# Altium schematic sheet gas.SchDoc
size A4; SheetNumber: 6; SheetTotal: 14; SPICEModelCacheDVYLCXBE: <root> / <DocumentId>DVYLCXBE</DocumentId> / </root>
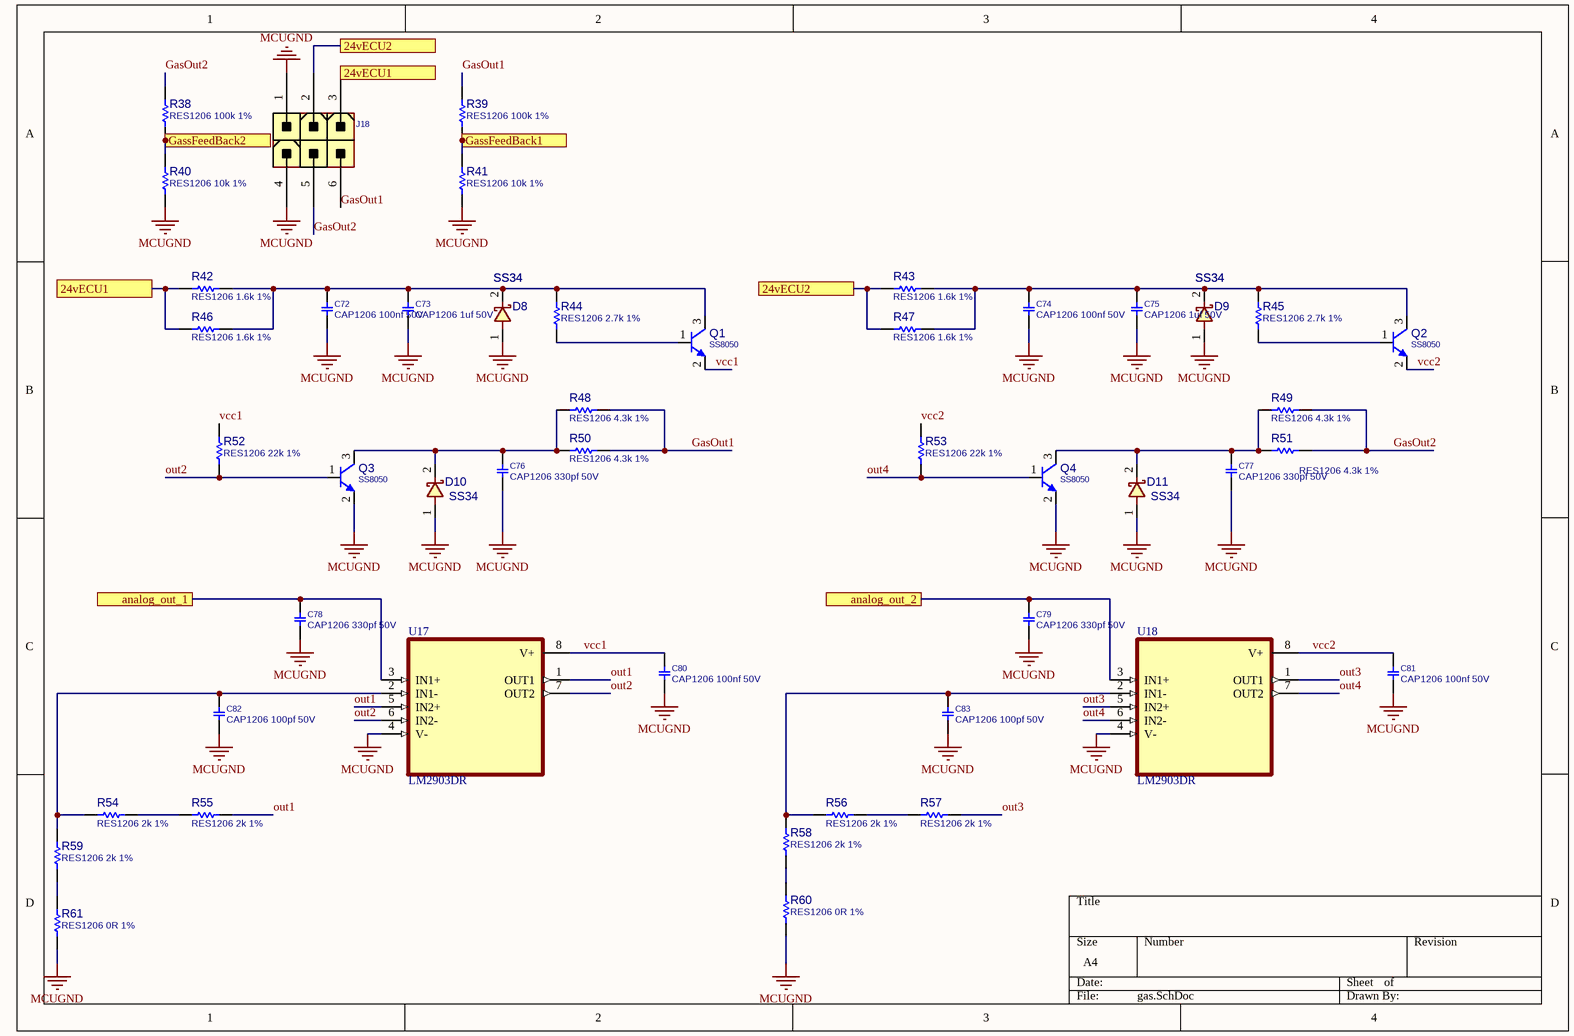
[diagram p0: gas.SchDoc]

## Parts
C72  CAP1206 100nf 50V  [C1206]
C73  CAP1206 1uf 50V  [C1206]
C74  CAP1206 100nf 50V  [C1206]
C75  CAP1206 1uf 50V  [C1206]
C76  CAP1206 330pf 50V  [C1206]
C77  CAP1206 330pf 50V  [C1206]
C78  CAP1206 330pf 50V  [C1206]
C79  CAP1206 330pf 50V  [C1206]
C80  CAP1206 100nf 50V  [C1206]
C81  CAP1206 100nf 50V  [C1206]
C82  CAP1206 100pf 50V  [C1206]
C83  CAP1206 100pf 50V  [C1206]
D8  SS34  [D_SMB]
D9  SS34  [D_SMB]
D10  SS34  [D_SMB]
D11  SS34  [D_SMB]
J18  CONN_ATXPWR_6  [ATXPWR_6]  (value not drawn)
Q1  SS8050  [SOT23_3]
Q2  SS8050  [SOT23_3]
Q3  SS8050  [SOT23_3]
Q4  SS8050  [SOT23_3]
R38  RES1206 100k 1%  [R1206]
R39  RES1206 100k 1%  [R1206]
R40  RES1206 10k 1%  [R1206]
R41  RES1206 10k 1%  [R1206]
R42  RES1206 1.6k 1%  [R1206]
R43  RES1206 1.6k 1%  [R1206]
R44  RES1206 2.7k 1%  [R1206]
R45  RES1206 2.7k 1%  [R1206]
R46  RES1206 1.6k 1%  [R1206]
R47  RES1206 1.6k 1%  [R1206]
R48  RES1206 4.3k 1%  [R1206]
R49  RES1206 4.3k 1%  [R1206]
R50  RES1206 4.3k 1%  [R1206]
R51  RES1206 4.3k 1%  [R1206]
R52  RES1206 22k 1%  [R1206]
R53  RES1206 22k 1%  [R1206]
R54  RES1206 2k 1%  [R1206]
R55  RES1206 2k 1%  [R1206]
R56  RES1206 2k 1%  [R1206]
R57  RES1206 2k 1%  [R1206]
R58  RES1206 2k 1%  [R1206]
R59  RES1206 2k 1%  [R1206]
R60  RES1206 0R 1%  [R1206]
R61  RES1206 0R 1%  [R1206]
U17  LM2903DR  [SOIC127P599X175-8N]
U18  LM2903DR  [SOIC127P599X175-8N]

## Ports
24vECU1, 24vECU2, analog_out_1, analog_out_2, GassFeedBack1, GassFeedBack2

## Nets
MCUGND: C72.2 C73.2 C74.2 C75.2 C76.2 C77.2 C78.2 C79.2 C80.2 C81.2 C82.2 C83.2 D8.1 D9.1 D10.1 D11.1 J18.1 J18.4 Q3.2(E) Q4.2(E) R40.2 R41.2 R60.2 R61.2 U17.4(V-) U18.4(V-)
24vECU1: J18.3 R42.2 R46.2 ; port 24vECU1
24vECU2: J18.2 R43.2 R47.2 ; port 24vECU2
analog_out_1: C78.1 U17.3(IN1+) ; port analog_out_1
analog_out_2: C79.1 U18.3(IN1+) ; port analog_out_2
GasOut1: J18.6 R39.1 R48.2 R50.2
GasOut2: J18.5 R38.1 R49.2 R51.2
GassFeedBack1: R39.2 R41.1 ; port GassFeedBack1
GassFeedBack2: R38.2 R40.1 ; port GassFeedBack2
out1: R55.2 U17.1(OUT1) U17.5(IN2+)
out2: Q3.1(B) R52.1 U17.6(IN2-) U17.7(OUT2)
out3: R57.2 U18.1(OUT1) U18.5(IN2+)
out4: Q4.1(B) R53.1 U18.6(IN2-) U18.7(OUT2)
vcc1: C80.1 Q1.2(E) R52.2 U17.8(V+)
vcc2: C81.1 Q2.2(E) R53.2 U18.8(V+)
NetC72_1: C72.1 C73.1 D8.2 Q1.3(C) R42.1 R44.2 R46.1
NetC74_1: C74.1 C75.1 D9.2 Q2.3(C) R43.1 R45.2 R47.1
NetC76_1: C76.1 D10.2 Q3.3(C) R48.1 R50.1
NetC77_1: C77.1 D11.2 Q4.3(C) R49.1 R51.1
NetC82_1: C82.1 R54.1 R59.1 U17.2(IN1-)
NetC83_1: C83.1 R56.1 R58.1 U18.2(IN1-)
NetQ1_1: Q1.1(B) R44.1
NetQ2_1: Q2.1(B) R45.1
NetR54_2: R54.2 R55.1
NetR56_2: R56.2 R57.1
NetR58_2: R58.2 R60.1
NetR59_2: R59.2 R61.1

## Library data of the parts
C72-C83 = CAP_SMD_MLCC_1206: CAP, MLCC; PARAM: -, -%; MANF_P#: MANF_PART#; PARAM2: -V; PRICE: 100= 1$; MANF: -; ASSEMBLY: ASSEMBLY
D8-D11 = DIODE_SMD_SCHOTTKY_SS34: DIODE, SCHOTTKY, 20V, 3A; MANF: VISHAY; DESC: DESCRIPTION; ASSEMBLY: ASSEMBLY; PRICE: PRICE; PARAM2: 3A; PARAM: 20V; VALUE: SS34
  D8 D9: MANF_P#: SS34
J18 = CONN_ATXPWR_6: CONN, ATX POWER, 6 P; MANF: TE; MANF_P#: 4-1775099-1; VALUE: CONN_ATXPWR_6; MountType: THD; PACKAGE: ATXPWR-6pin; Part Type: Conn.
Q1-Q4 = NPN_MMBT8050_SOT23: BJT, NPN, 25v, 1.5A, SMD, SOT23; PARAM2: 300mW; MANF: GALAXY; PARAM: 25v, 1.5A; MANF_P#: MMBT8050; PRICE: 0.09t@JAVAN; VALUE: SS8050; PACKAGE: SOT-23
R38-R61 = RES_SMD_1206: RESISTOR, SMD; PARAM: 1%, 0.25W; DESC: DESCRIPTION; DIST#: MOUSER; MANF_P#: -; MANF: -; ASSEMBLY: ASSEMBLY; PRICE: -; PARAM2: -
U17 U18 = LM358BAIDR: Dual, 36-V, 1.2-MHz, 2-mV offset voltage operational amplifier; MF: Texas Instruments; SnapEDA_Link: https://www.snapeda.com/parts/LM358BAIDR/Texas+Instruments/view-part/?ref=snap; Package: SOIC-8 Texas Instruments; Value: *; MP: LM358BAIDR; Check_prices: https://www.snapeda.com/parts/LM358BAIDR/Texas+Instruments/view-part/?ref=eda